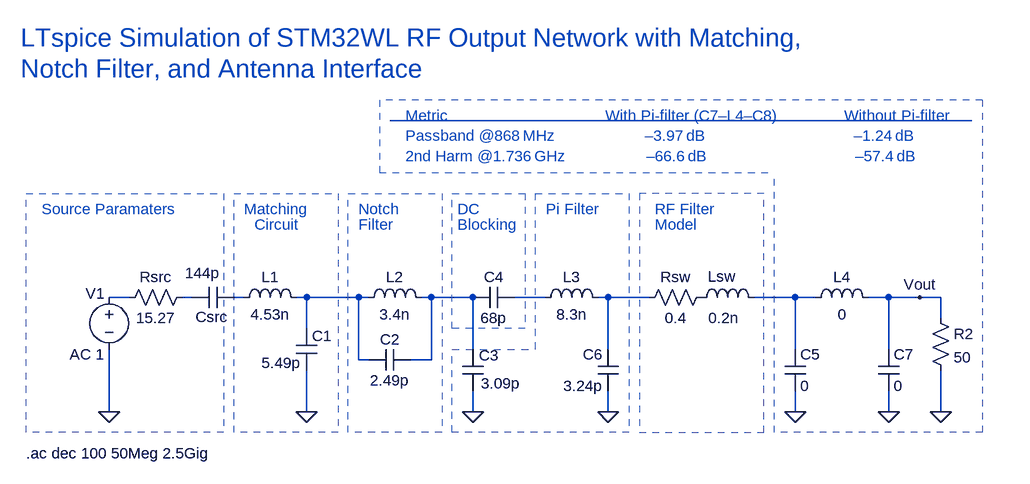
[diagram p0: schematic LoRa_RF_Cct.asc]
LoRa_RF_Cct.asc, the LTspice schematic file:
Version 4.1
SHEET 1 1960 680
WIRE 1424 -160 528 -160
WIRE 128 112 96 112
WIRE 224 112 208 112
WIRE 304 112 288 112
WIRE 400 112 384 112
WIRE 480 112 400 112
WIRE 496 112 480 112
WIRE 592 112 576 112
WIRE 656 112 592 112
WIRE 768 112 720 112
WIRE 864 112 848 112
WIRE 928 112 864 112
WIRE 1152 112 1088 112
WIRE 1184 112 1152 112
WIRE 1296 112 1264 112
WIRE 1344 112 1296 112
WIRE 1376 112 1344 112
WIRE 1376 144 1376 112
WIRE 400 160 400 112
WIRE 656 192 656 112
WIRE 864 192 864 112
WIRE 1152 192 1152 112
WIRE 1296 192 1296 112
WIRE 480 208 480 112
WIRE 496 208 480 208
WIRE 592 208 592 112
WIRE 592 208 560 208
WIRE 96 288 96 192
WIRE 400 288 400 224
WIRE 656 288 656 256
WIRE 864 288 864 256
WIRE 1152 288 1152 256
WIRE 1296 288 1296 256
WIRE 1376 288 1376 224
FLAG 96 288 0
FLAG 400 288 0
FLAG 1376 288 0
FLAG 656 288 0
FLAG 864 288 0
FLAG 1296 288 0
FLAG 1152 288 0
FLAG 1344 112 Vout
SYMBOL voltage 96 96 R0
WINDOW 0 -36 10 Left 2
WINDOW 123 -61 104 Left 2
WINDOW 39 0 0 Left 0
SYMATTR InstName V1
SYMATTR Value ""
SYMATTR Value2 AC 1
SYMBOL res 224 96 R90
WINDOW 0 0 56 VBottom 2
WINDOW 3 32 56 VTop 2
SYMATTR InstName Rsrc
SYMATTR Value 15.27
SYMBOL cap 224 128 R270
WINDOW 0 -30 30 VTop 2
WINDOW 3 69 16 VBottom 2
SYMATTR InstName Csrc
SYMATTR Value 144p
SYMBOL ind 288 128 R270
WINDOW 0 32 56 VTop 2
WINDOW 3 5 56 VBottom 2
SYMATTR InstName L1
SYMATTR Value 4.53n
SYMBOL cap 384 160 R0
WINDOW 0 24 11 Left 2
WINDOW 3 -53 53 Left 2
SYMATTR InstName C1
SYMATTR Value 5.49p
SYMBOL res 1360 128 R0
SYMATTR InstName R2
SYMATTR Value 50
SYMBOL ind 480 128 R270
WINDOW 0 32 56 VTop 2
WINDOW 3 5 56 VBottom 2
SYMATTR InstName L2
SYMATTR Value 3.4n
SYMBOL cap 560 192 R90
WINDOW 0 0 32 VBottom 2
WINDOW 3 32 32 VTop 2
SYMATTR InstName C2
SYMATTR Value 2.49p
SYMBOL cap 720 96 R90
WINDOW 0 0 32 VBottom 2
WINDOW 3 32 32 VTop 2
SYMATTR InstName C4
SYMATTR Value 68p
SYMBOL cap 672 256 R180
WINDOW 0 -24 55 Left 2
WINDOW 3 -57 12 Left 2
SYMATTR InstName C3
SYMATTR Value 3.09p
SYMBOL cap 880 256 R180
WINDOW 0 24 56 Left 2
WINDOW 3 24 8 Left 2
SYMATTR InstName C6
SYMATTR Value 3.24p
SYMBOL ind 752 128 R270
WINDOW 0 32 56 VTop 2
WINDOW 3 5 56 VBottom 2
SYMATTR InstName L3
SYMATTR Value 8.3n
SYMBOL res 1024 96 R90
WINDOW 0 0 56 VBottom 2
WINDOW 3 32 56 VTop 2
SYMATTR InstName Rsw
SYMATTR Value 0.4
SYMBOL ind 992 128 R270
WINDOW 0 33 47 VTop 2
WINDOW 3 0 50 VBottom 2
SYMATTR InstName Lsw
SYMATTR Value 0.2n
SYMBOL cap 1136 192 R0
SYMATTR InstName C5
SYMATTR Value 0
SYMBOL cap 1280 192 R0
SYMATTR InstName C7
SYMATTR Value 0
SYMBOL ind 1168 128 R270
WINDOW 0 32 56 VTop 2
WINDOW 3 5 56 VBottom 2
SYMATTR InstName L4
SYMATTR Value 0
TEXT -32 352 Left 2 !.ac dec 100 50Meg 2.5Gig
TEXT -8 -24 Left 2 ;Source Paramaters
TEXT 304 -24 Left 2 ;Matching
TEXT 320 0 Left 2 ;Circuit
TEXT 480 -24 Left 2 ;Notch
TEXT 480 0 Left 2 ;Filter
TEXT 632 -24 Left 2 ;DC
TEXT 632 0 Left 2 ;Blocking
TEXT 768 -24 Left 2 ;Pi Filter
TEXT 936 -24 Left 2 ;RF Filter
TEXT 936 0 Left 2 ;Model
TEXT 552 -168 Left 2 ;Metric                                   With Pi-filter (C7–L4–C8)               Without Pi-filter              \nPassband @868 MHz                    –3.97 dB                                 –1.24 dB       \n2nd Harm @1.736 GHz                  –66.6 dB                                 –57.4 dB
TEXT -40 -288 Left 4 ;LTspice Simulation of STM32WL RF Output Network with Matching,
TEXT -40 -240 Left 4 ;Notch Filter, and Antenna Interface
LINE Normal 624 320 624 192 2
LINE Normal 752 192 752 -48 2
LINE Normal 624 192 752 192 2
LINE Normal 896 320 624 320 2
LINE Normal 896 -48 896 320 2
LINE Normal 752 -48 896 -48 2
LINE Normal 1104 -48 912 -48 2
LINE Normal 1104 320 1104 -48 2
LINE Normal 912 320 1104 320 2
LINE Normal 912 -48 912 320 2
LINE Normal 1120 320 1120 -80 2
LINE Normal 1440 320 1120 320 2
LINE Normal 1440 -192 1440 320 2
LINE Normal 512 -80 1120 -80 2
LINE Normal 512 -192 512 -80 2
LINE Normal 1440 -192 512 -192 2
RECTANGLE Normal 272 320 -32 -48 2
RECTANGLE Normal 448 320 288 -48 2
RECTANGLE Normal 608 320 464 -48 2
RECTANGLE Normal 736 160 624 -48 2

The netlist it stands for:
* LoRa_RF_Cct.asc
V1 N002 0 AC 1
Rsrc N003 N002 15.27
Csrc N003 N004 144p
L1 N004 N005 4.53n
C1 N005 0 5.49p
R2 Vout 0 50
L2 N005 N006 3.4n
C2 N006 N005 2.49p
C4 N007 N006 68p
C3 0 N006 3.09p
C6 0 N008 3.24p
L3 N007 N008 8.3n
Rsw P001 N008 0.4
Lsw P001 N009 0.2n
C5 N009 0 0
C7 Vout 0 0
L4 N009 Vout 0
.ac dec 100 50Meg 2.5Gig
* Source Paramaters
* Matching
* Circuit
* Notch
* Filter
* DC
* Blocking
* Pi Filter
* RF Filter
* Model
* Metric                                   With Pi-filter (C7–L4–C8)               Without Pi-filter
* Passband @868 MHz                    –3.97 dB                                 –1.24 dB
* 2nd Harm @1.736 GHz                  –66.6 dB                                 –57.4 dB
* LTspice Simulation of STM32WL RF Output Network with Matching,
* Notch Filter, and Antenna Interface
.backanno
.end